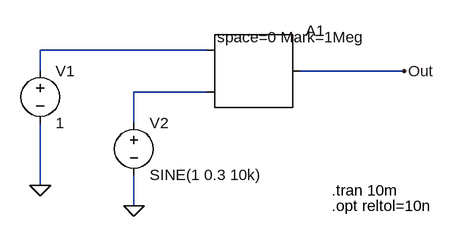
[diagram p0: schematic Modulator.asc]
Modulator.asc, the LTspice schematic file:
Version 4.1
SHEET 1 880 680
WIRE 144 96 -112 96
WIRE -112 128 -112 96
WIRE 448 128 288 128
WIRE 144 160 32 160
WIRE 32 208 32 160
WIRE -112 304 -112 208
WIRE 32 336 32 288
FLAG -112 304 0
FLAG 32 336 0
FLAG 448 128 Out
SYMBOL SpecialFunctions\\modulate 144 96 R0
WINDOW 3 16 -20 Left 2
SYMATTR InstName A1
SYMATTR Value space=0 Mark=1Meg
SYMBOL voltage -112 112 R0
WINDOW 123 0 0 Left 0
WINDOW 39 0 0 Left 0
SYMATTR InstName V1
SYMATTR Value 1
SYMBOL voltage 32 192 R0
WINDOW 123 0 0 Left 0
WINDOW 39 0 0 Left 0
SYMATTR InstName V2
SYMATTR Value SINE(1 0.3 10k)
TEXT 336 312 Left 2 !.tran 10m
TEXT 336 336 Left 2 !.opt reltol=10n

The netlist it stands for:
* Modulator.asc
A1 N001 N002 0 0 0 0 Out 0 MODULATOR space=0 Mark=1Meg
V1 N001 0 1
V2 N002 0 SINE(1 0.3 10k)
.tran 10m
.opt reltol=10n
.backanno
.end